# EasyEDA Pro project mini_autotune_v0.6_20261118-0322.epro

# Schematic Main

## Sheets
1 电源
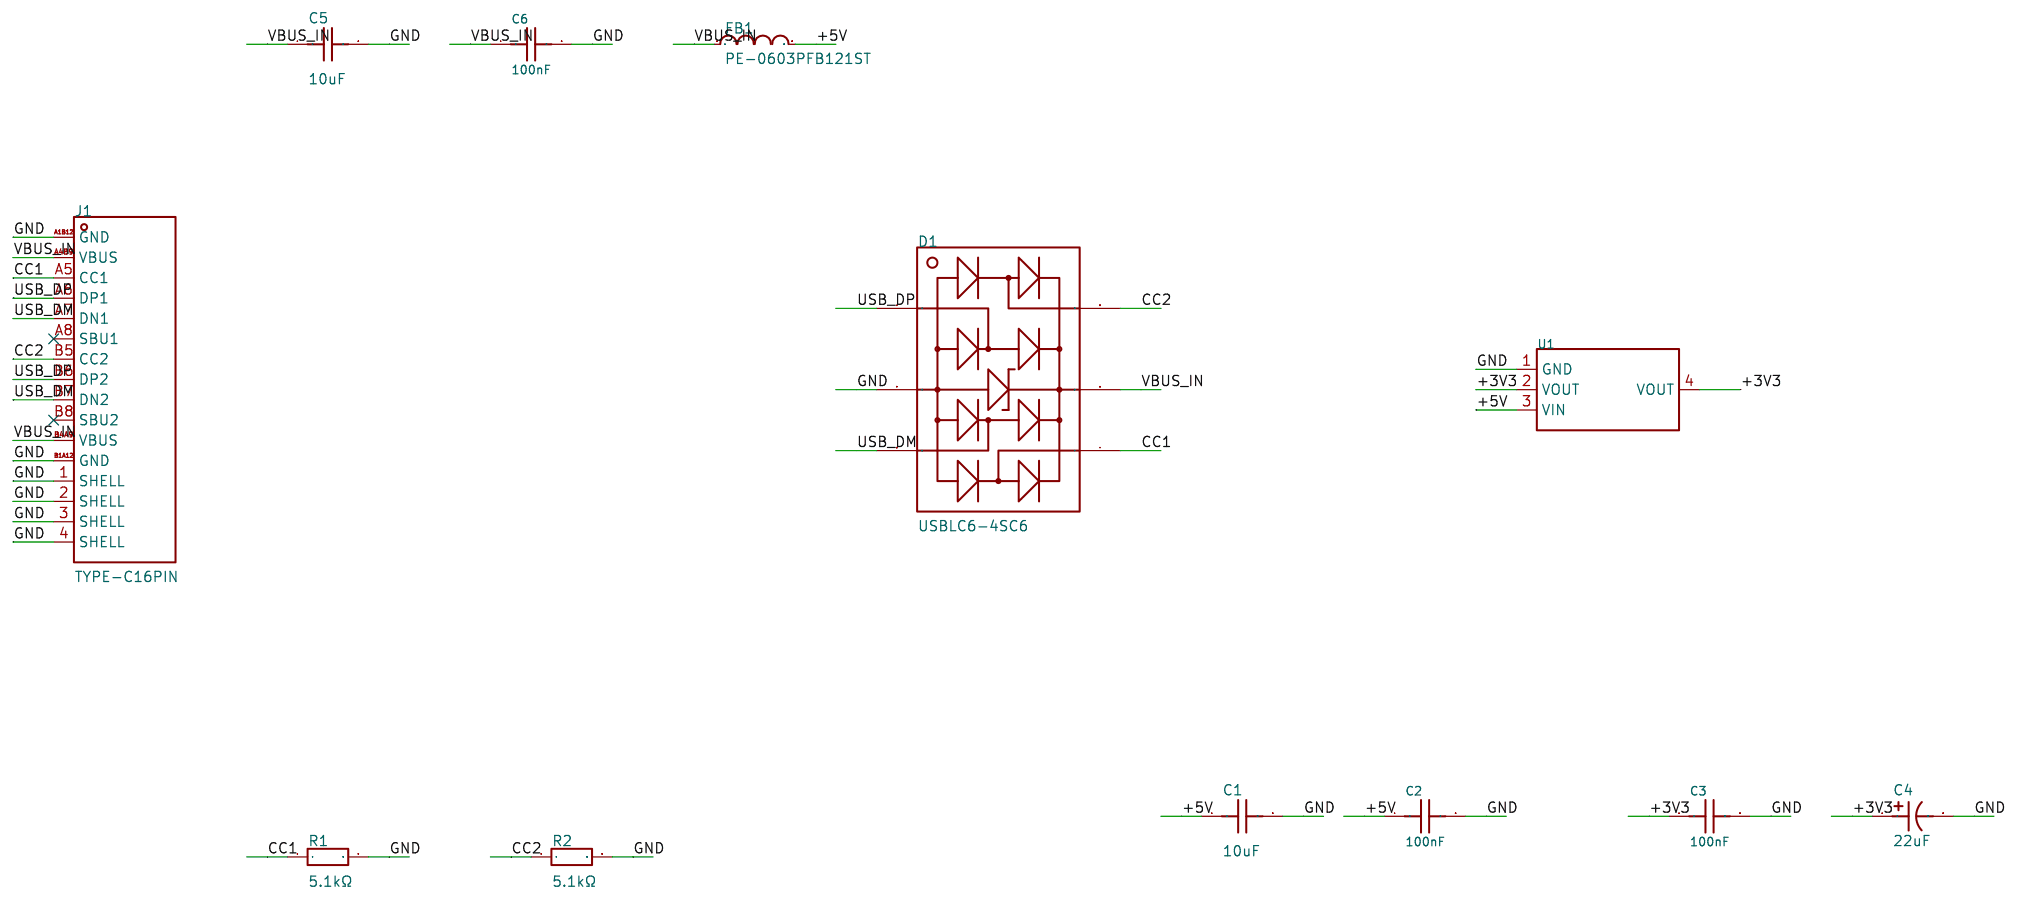
[diagram p0: 电源]
2 主控
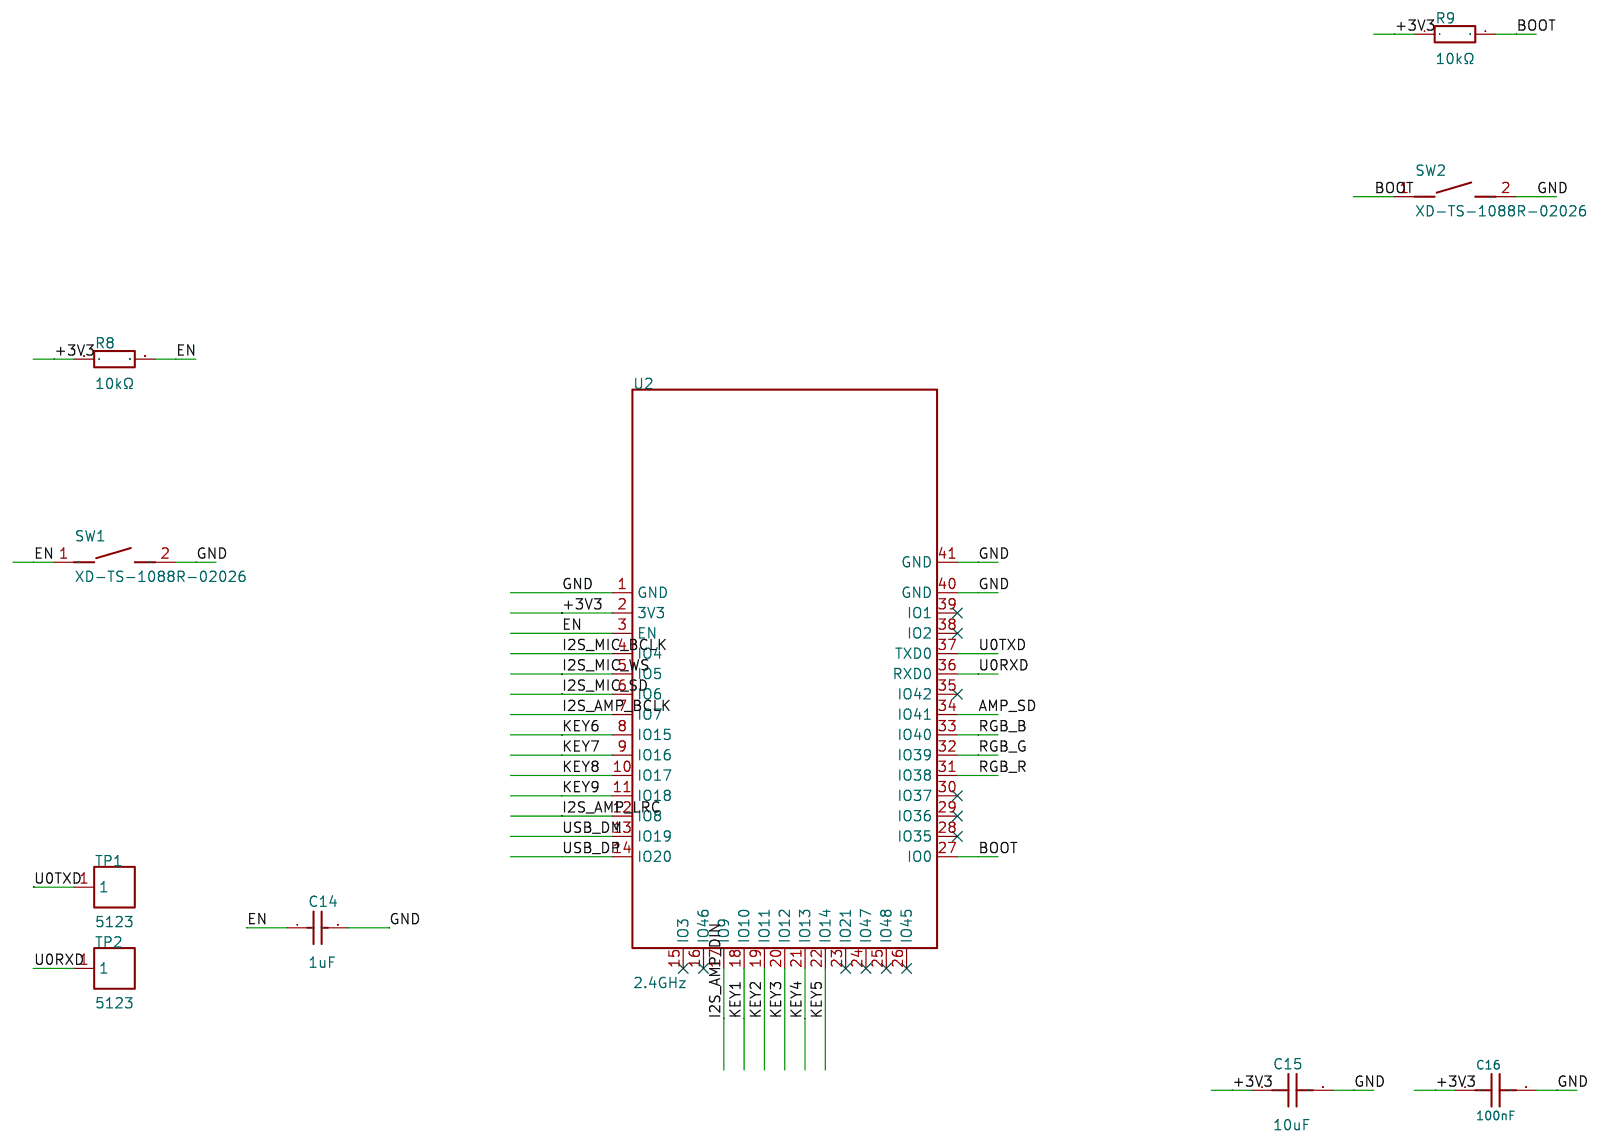
[diagram p1: 主控]
3 音频
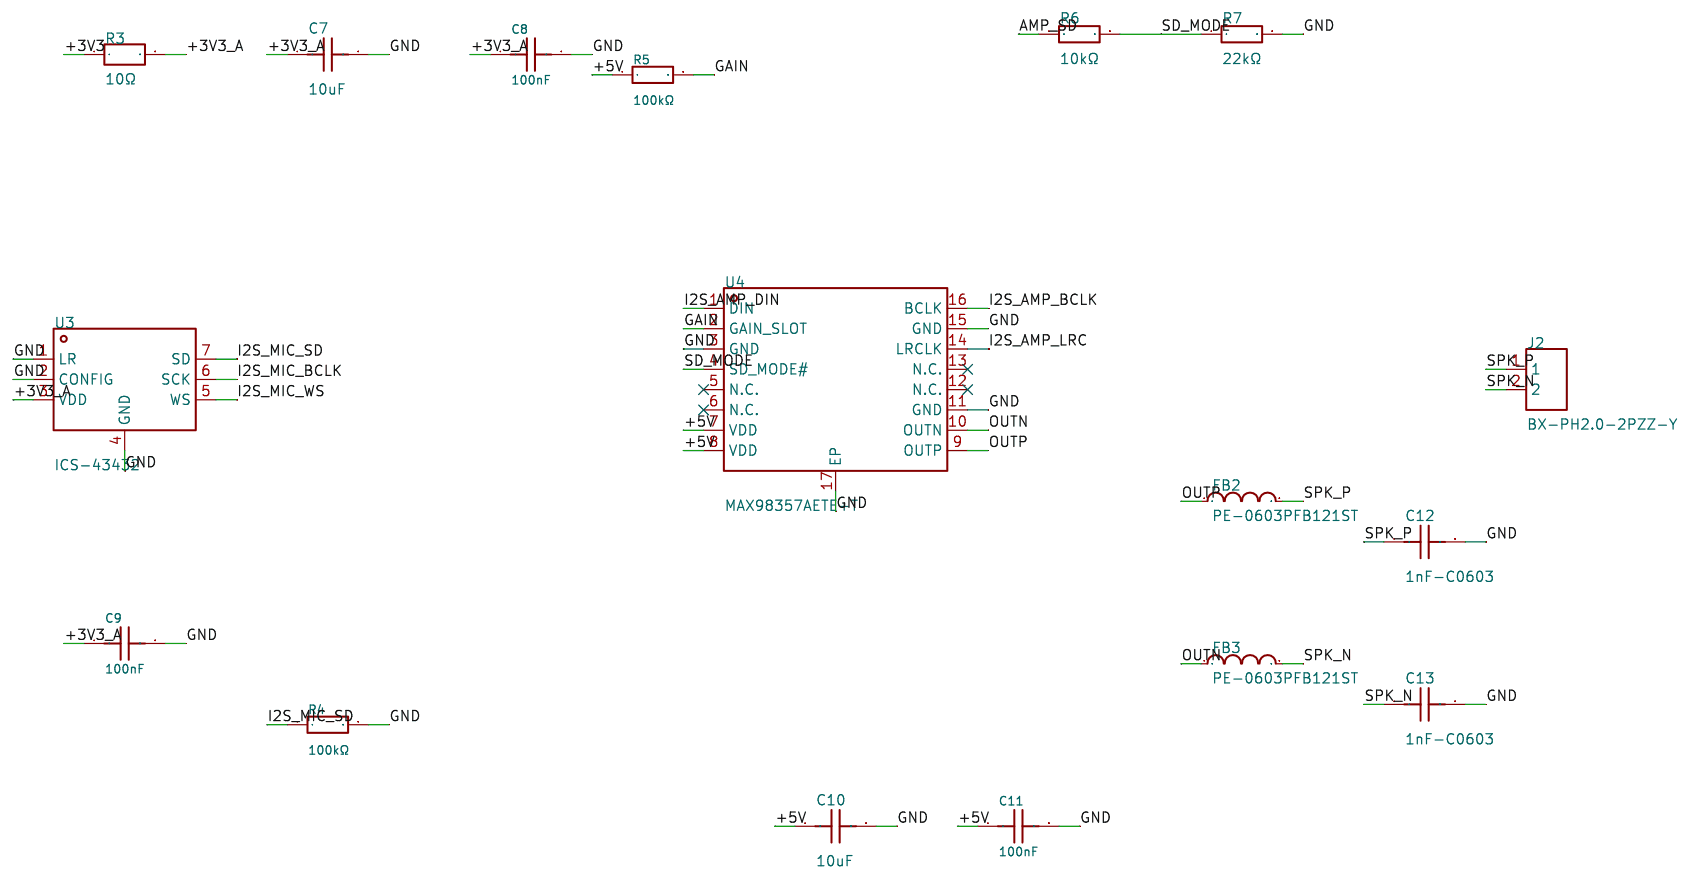
[diagram p2: 音频]
4 人机交互
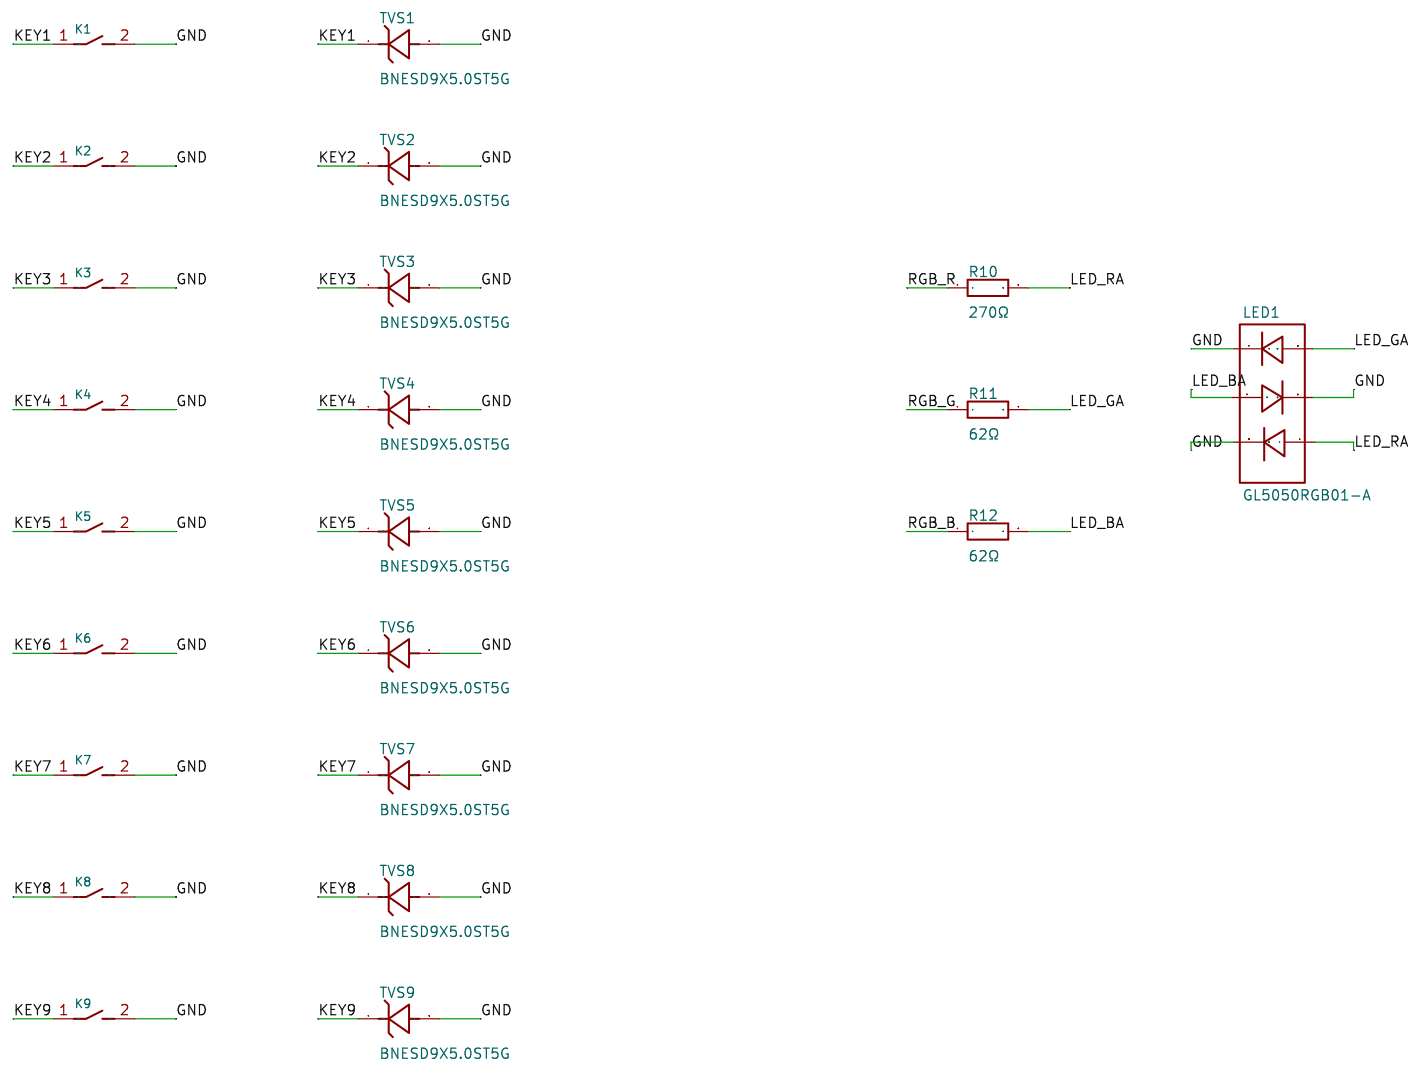
[diagram p3: 人机交互]

## Parts
sheet 主控
C14  1uF  [C0603]
C15  10uF  [C0603]
C16  100nF  [C0603]
R8  10kΩ  [R0603]
R9  10kΩ  [R0603]
SW1  XD-TS-1088R-02026  [SW-SMD_L3.9-W3.0_TS-1088-AR02026]
SW2  XD-TS-1088R-02026  [SW-SMD_L3.9-W3.0_TS-1088-AR02026]
TP1  5123  [TP-TH_5123]  (no BOM)
TP2  5123  [TP-TH_5123]  (no BOM)
U2  2.4GHz  [WIRELM-SMD_ESP32-S3-WROOM-1]
sheet 人机交互
K1  TS50610-411-02028  [KEY-SMD_L3.9-W3.0-LS5.0_1]
K2  TS50610-411-02028  [KEY-SMD_L3.9-W3.0-LS5.0_1]
K3  TS50610-411-02028  [KEY-SMD_L3.9-W3.0-LS5.0_1]
K4  TS50610-411-02028  [KEY-SMD_L3.9-W3.0-LS5.0_1]
K5  TS50610-411-02028  [KEY-SMD_L3.9-W3.0-LS5.0_1]
K6  TS50610-411-02028  [KEY-SMD_L3.9-W3.0-LS5.0_1]
K7  TS50610-411-02028  [KEY-SMD_L3.9-W3.0-LS5.0_1]
K8  TS50610-411-02028  [KEY-SMD_L3.9-W3.0-LS5.0_1]
K9  TS50610-411-02028  [KEY-SMD_L3.9-W3.0-LS5.0_1]
LED1  GL5050RGB01-A  [LED-SMD_6P-L5.0-W5.0_GL5050RGB01-A]
R10  270Ω  [R0603]
R11  62Ω  [R0603]
R12  62Ω  [R0603]
TVS1  BNESD9X5.0ST5G  [DFN1006-2L-RD]
TVS2  BNESD9X5.0ST5G  [DFN1006-2L-RD]
TVS3  BNESD9X5.0ST5G  [DFN1006-2L-RD]
TVS4  BNESD9X5.0ST5G  [DFN1006-2L-RD]
TVS5  BNESD9X5.0ST5G  [DFN1006-2L-RD]
TVS6  BNESD9X5.0ST5G  [DFN1006-2L-RD]
TVS7  BNESD9X5.0ST5G  [DFN1006-2L-RD]
TVS8  BNESD9X5.0ST5G  [DFN1006-2L-RD]
TVS9  BNESD9X5.0ST5G  [DFN1006-2L-RD]
sheet 电源
C1  10uF  [C0603]
C2  100nF  [C0603]
C3  100nF  [C0603]
C4  22uF  [CAP-SMD_L3.2-W1.6]
C5  10uF  [C0603]
C6  100nF  [C0603]
D1  USBLC6-4SC6  [SOT-23-6_L2.9-W1.6-P0.95-LS2.8-BR]
FB1  PE-0603PFB121ST  [L0603]
J1  TYPE-C16PIN  [USB-C-SMD_TYPE-C16PIN]
R1  5.1kΩ  [R0603]
R2  5.1kΩ  [R0603]
U1  AMS1117-3.3  [SOT-223-3_L6.5-W3.4-P2.30-LS7.0-BR]
sheet 音频
C7  10uF  [C0603]
C8  100nF  [C0603]
C9  100nF  [C0603]
C10  10uF  [C0603]
C11  100nF  [C0603]
C12  1nF-C0603  [C0603]
C13  1nF-C0603  [C0603]
FB2  PE-0603PFB121ST  [L0603]
FB3  PE-0603PFB121ST  [L0603]
J2  BX-PH2.0-2PZZ-Y  [CONN-TH_2P-P2.00_HC-PH-2A-TW]
R3  10Ω  [R0603]
R4  100kΩ  [R0603]
R5  100kΩ  [R0603]
R6  10kΩ  [R0603]
R7  22kΩ  [R0603]
U3  ICS-43432  [SENSOR-SMD_ICS-43432]
U4  MAX98357AETE+T  [TQFN-16_L3.0-W3.0-P0.50-BL-EP1.5]

## Library data of the parts
C14 = CL10B105KA8NNNC: 容值:1uF;精度:±10%;额定电压:25V;温度系数:X7R;; LCSC Part Name: 1uF ±10% 25V; Supplier Part: C29936; Manufacturer: SAMSUNG(三星); Supplier Footprint: 0603; JLCPCB Part Class: Extended Part; Datasheet: https://item.szlcsc.com/datasheet/CL10B105KA8NNNC/30690.html; Supplier: LCSC; Tolerance: ±10%; Voltage Rating: 25V; Temperature Coefficient: X7R
C1 C5 C7 C10 C15 = CL10A106MA8NRNC: 容值:10uF;精度:±20%;额定电压:25V;温度系数:X5R;; LCSC Part Name: 10uF ±20% 25V; Supplier Part: C96446; Manufacturer: SAMSUNG(三星); Supplier Footprint: 0603; JLCPCB Part Class: Basic Part; Datasheet: https://item.szlcsc.com/datasheet/CL10A106MA8NRNC/97651.html; Supplier: LCSC; Tolerance: ±20%; Voltage Rating: 25V; Temperature Coefficient: X5R; PCB Layer: Default
C2 C3 C6 C8 C9 C11 C16 = CC0603KRX7R9BB104: 容值:100nF;精度:±10%;额定电压:50V;温度系数:X7R;; LCSC Part Name: 100nF ±10% 50V; Supplier Part: C14663; Manufacturer: YAGEO(国巨); Supplier Footprint: 0603; JLCPCB Part Class: Basic Part; Datasheet: https://item.szlcsc.com/datasheet/CC0603KRX7R9BB104/15331.html; Supplier: LCSC; Tolerance: ±10%; Voltage Rating: 50V; Temperature Coefficient: X7R; PCB Layer: Default
R6 R8 R9 = 0603WAF1002T5E: 电阻类型:厚膜电阻;阻值:10kΩ;精度:±1%;功率:100mW;工作电压:75V;温度系数:±100ppm/℃;; LCSC Part Name: 厚膜电阻 10kΩ ±1% 100mW; Supplier Part: C25804; Manufacturer: UNI-ROYAL(厚声); Supplier Footprint: 0603; JLCPCB Part Class: Basic Part; Datasheet: https://item.szlcsc.com/datasheet/0603WAF1002T5E/26547.html; Supplier: LCSC; Type: 厚膜电阻; Tolerance: ±1%; Power(Watts): 100mW; Voltage-Supply(Max): 75V; Temperature Coefficient: ±100ppm/℃; Operating Temperature: -55℃~+155℃; PCB Layer: Default
SW1 SW2 = TS-1088-AR03016: 轻触开关 3.9x3.0mm SMD 2脚; LCSC Part Name: 轻触开关 3.9x3.0 立贴; Supplier Part: C56165515; Manufacturer: chxunda(讯普); Supplier Footprint: SMD,3.9x3mm; JLCPCB Part Class: Extended Part; Datasheet: https://www.lcsc.com/product-detail/C56165515.html; Supplier: LCSC; PCB Layer: Default
TP1 TP2 = 5123: 特性：彩色标记,便于观察和快速识别。是PC测试点终端的经济选择。卡扣式安装,为波峰焊提供可靠固定。线环设计,确保安全防滑测试。节省空间,有超薄和低轮廓设计。高轮廓设计,适用于难以触及的应用。适用于0.062(1.57)和0.093(2.36)PC板的高密度封装。可有效替代绕线柱和绕线架。能牢固夹住J型钩、EZ型钩、抓取器、鳄鱼夹、测试头或探针。高温尼龙底座,非常适合回流焊。非常适合可靠的生产测试和现场服务故障排除; LCSC Part Name: 通孔安装测试点，颜色标识; Supplier Part: C5272786; Manufacturer: Keystone; JLCPCB Part Class: Extended Part; Datasheet: https://item.szlcsc.com/datasheet/5123/6001347.html; Supplier: LCSC; Connector Type: 插针型(穿板); Plastic Color: 灰色; Board Space (Diameter φ/ Length x Width): 3.2mm
U2 = ESP32-S3-WROOM-1-N16R8: 核心芯片:ESP32-S3R8;频率:2.4GHz;天线形式:板载PCB天线;发射功率:20.5dBm;接收灵敏度:-103.5dBm;; LCSC Part Name: 不带固件 通用型Wi-Fi+低功耗蓝牙MCU模组; Supplier Part: C2913202; Manufacturer: ESPRESSIF(乐鑫); Supplier Footprint: SMD,25.5x18mm; JLCPCB Part Class: Extended Part; Datasheet: https://item.szlcsc.com/datasheet/ESP32-S3-WROOM-1-N16R8/3198300.html; Supplier: LCSC; Utilized IC / Part: ESP32-S3R8; Interface Type: I2C；GPIO；UART；SPI；USB；I2S; Antenna Type: 板载PCB天线; Output Power: 20.5dBm; Voltage - Supply: 3V~3.6V; Receive  Current: 95mA; Send  Current: 355mA; Sensitivity: -103.5dBm; Operating Temperature: -40℃~+65℃; PCB Layer: Default
K1-K9 = TS50610-411-02028: 电路结构:单刀单掷;按钮形状:圆形按钮;安装方式:立贴;开关长度:4mm;开关宽度:3mm;开关高度:2mm;带支架:不带支架;触点电流:50mA;额定电压:12V;; LCSC Part Name: 3.9*2.93*2mm 立贴 轻触开关; Supplier Part: C42400866; Manufacturer: HMTCONN(华明通); Supplier Footprint: SMD,3.9x3mm; JLCPCB Part Class: Extended Part; Datasheet: https://item.szlcsc.com/datasheet/TS50610-411-02028/44355790.html; Supplier: LCSC; Circuit: 单刀单掷; Actuator Style: 圆形按钮; Mounting Type: 立贴; Length: 4mm; Width: 3mm; Switch Height: 2mm; with Bracket: 不带支架; Contact Current: 50mA; Voltage Rating: 12V; Actuator/Cap Color: 黑色; Termination Style: SMD接片
LED1 = GL5050RGB01-A: 5050RGB 0.2w 共阴 透明 缺口负 负极朝孔; LCSC Part Name: 5050RGB 0.2w 共阴 透明 缺口负 负极朝孔; Supplier Part: C51933351; Manufacturer: Guiguang light(桂光光电); Supplier Footprint: SMD5050-6P; JLCPCB Part Class: Extended Part; Datasheet: https://item.szlcsc.com/datasheet/GL5050RGB01-A/54646047.html; Supplier: LCSC; Diode Configuration: 共阴极; Dominant Wavelength - R: 610nm~630nm; Dominant Wavelength - G: 515nm~530nm; Dominant Wavelength - B: 460nm~475nm; Viewing Angle: 120°; Lens Color: 白色透镜; Peak Wavelength - R: 625nm; Peak Wavelength - G: 525nm; Peak Wavelength - B: 470nm; Operating Temperature: -40℃~+85℃; Length: 5.4mm; Width: 5mm; Height: 1.6mm; Luminous Intensity - R: 300mcd~500mcd; Luminous Intensity - G: 1000mcd~1200mcd; Luminous Intensity - B: 350mcd~450mcd; Forward Voltage(Vf) - R: 2V~2.3V; Forward Voltage(Vf) - G: 2.9V~3.2V; Forward Voltage(Vf) - B: 2.9V~3.2V; Forward Current - R: 20mA; Forward Current - G: 20mA; Forward Current - B: 20mA; Power(Watts) - R: 70mW; Power(Watts) - G: 90mW; Power(Watts) - B: 90mW; PCB Layer: Default
R10 = 0603WAF2700T5E: 电阻类型:厚膜电阻;阻值:270Ω;精度:±1%;功率:100mW;工作电压:75V;温度系数:±100ppm/℃;; LCSC Part Name: 270Ω ±1% 100mW 厚膜电阻; Supplier Part: C22966; Manufacturer: UNI-ROYAL(厚声); Supplier Footprint: 0603; JLCPCB Part Class: Basic Part; Datasheet: https://item.szlcsc.com/datasheet/0603WAF2700T5E/23693.html; Supplier: LCSC; Type: 厚膜电阻; Tolerance: ±1%; Power(Watts): 100mW; Voltage-Supply(Max): 75V; Temperature Coefficient: ±100ppm/℃; Operating Temperature: -55℃~+155℃; PCB Layer: Default
R11 R12 = RC0603FR-0762RL: 电阻类型:厚膜电阻;阻值:62Ω;精度:±1%;功率:100mW;工作电压:75V;温度系数:±100ppm/℃;; LCSC Part Name: 厚膜电阻 62Ω ±1% 100mW; Supplier Part: C245989; Manufacturer: YAGEO(国巨); Supplier Footprint: 0603; JLCPCB Part Class: Extended Part; Datasheet: https://item.szlcsc.com/datasheet/RC0603FR-0762RL/243490.html; Supplier: LCSC; Type: 厚膜电阻; Tolerance: ±1%; Power(Watts): 100mW; Voltage-Supply(Max): 75V; Temperature Coefficient: ±100ppm/℃; Operating Temperature: -55℃~+155℃; PCB Layer: Default
TVS1-TVS9 = BNESD9X5.0ST5G: 极性:单向;反向截止电压(Vrwm):5V;钳位电压:12V;峰值脉冲电流(Ipp):7A@8/20us;峰值脉冲功率(Ppp):70W@8/20us;击穿电压(VBR):7.2V;; LCSC Part Name: 单向ESD 5V截止 峰值浪涌电流：7A@8/20us; Supplier Part: C19077972; Manufacturer: BORN(伯恩半导体); Supplier Footprint: DFN1006-2; JLCPCB Part Class: Extended Part; Datasheet: https://item.szlcsc.com/datasheet/BNESD9X5.0ST5G/20278809.html; Supplier: LCSC; Polarity: 单向; Reverse Stand-Off Voltage (Vrwm): 5V; Clamping Voltage: 12V; Peak Pulse Current (Ipp): 7A@8/20us; Peak Pulse Power Dissipation (Ppp): 70W@8/20us; Voltage - Breakdown: 7.2V; Reverse Leakage Current (Ir): 500nA; Number of Channels: 单路; level of protection: IEC 61000-4-4；IEC 61000-4-5；IEC 61000-4-2; Type: ESD; Junction Capacitance: 50pF; PCB Layer: Default
C4 = CA45-A-16V-22uF-K: 容值:22uF;精度:±10%;额定电压:16V;等效串联电阻(ESR):6Ω@100kHz;; LCSC Part Name: 22uF ±10% 16V; Supplier Part: C782264; Manufacturer: CEC(振华新云); Supplier Footprint: CASE-A-3216-16(mm); JLCPCB Part Class: Extended Part; Datasheet: https://item.szlcsc.com/datasheet/CA45-A-16V-22uF-K/836060.html; Supplier: LCSC; Tolerance: ±10%; Voltage Rating: 16V; Equivalent Series Resistance(ESR): 6Ω@100kHz; Operating Temperature: -55℃~+125℃; PCB Layer: Default
D1 = USBLC6-4SC6: 反向截止电压(Vrwm):5.25V;最大钳位电压:17V;峰值脉冲电流(Ipp)@10/1000us:5A;击穿电压:6V;; Supplier Part: C252436; Supplier Footprint: SOT-23-6; JLCPCB Part Class: Extended Part; Datasheet: https://atta.szlcsc.com/upload/public/pdf/source/20180716/C252436_B87140B9F71D34601A0A2B5675133B53.pdf; Supplier: LCSC; Reverse Stand-Off Voltage (Vrwm): 5.25V; Maximum Clamping Voltage: 17V; Peak Pulse Current (Ipp)@10/1000us: 5A; Breakdown Voltage: 6V; Type: ESD; PCB Layer: Default
FB1-FB3 = PE-0603PFB121ST: 阻抗@频率:120Ω@100MHz;误差:±25%;直流电阻(DCR):50mΩ;; LCSC Part Name: 120 Ω @ 100MHz 2A; Supplier Part: C2661472; Manufacturer: PULSE(普思); Supplier Footprint: 0603; JLCPCB Part Class: Extended Part; Datasheet: https://item.szlcsc.com/datasheet/PE-0603PFB121ST/2753383.html; Supplier: LCSC; Impedance @ Frequency: 120Ω@100MHz; Tolerance: ±25%; DC Resistance(DCR): 50mΩ; Current Rating: 2A; Number of Circuits: 1; Operating Temperature: -40℃~+125℃; PCB Layer: Default
J1 = TYPE-C16PIN: 连接器类型:Type-C;协议标准:-;公母:母;安装方式:卧贴;触点数量:16P;端口数量:1;额定电流 - 电源:3A;工作温度:-25℃~+85℃;; LCSC Part Name: Type-C 母 卧贴; Supplier Part: C393939; Manufacturer: SHOU HAN(首韩); Supplier Footprint: SMD; JLCPCB Part Class: Extended Part; Datasheet: https://item.szlcsc.com/datasheet/TYPE-C16PIN/372551.html; Supplier: LCSC; Connector Type: Type-C; Gender: 母; Mounting Type: 卧贴; Number of Contacts: 16P; Number of Ports: 1; Current Rating-Power: 3A; Voltage Rating: 5V; Connect-Disconnect Life: 1万次; Length: 7.35mm; Detection color: 黑色; Operating Temperature: -25℃~+85℃
R1 R2 = RMC06035.1K1%N: 电阻类型:厚膜电阻;阻值:5.1kΩ;精度:±1%;功率:100mW;工作电压:50V;温度系数:±100ppm/℃;; LCSC Part Name: 厚膜电阻 5.1kΩ ±1% 100mW; Supplier Part: C269716; Manufacturer: Tyohm(幸亚电阻); Supplier Footprint: 0603; JLCPCB Part Class: Extended Part; Datasheet: https://item.szlcsc.com/datasheet/RMC06035.1K1%2525N/259156.html; Supplier: LCSC; Type: 厚膜电阻; Tolerance: ±1%; Power(Watts): 100mW; Voltage-Supply(Max): 50V; Temperature Coefficient: ±100ppm/℃; Operating Temperature: -55℃~+155℃; PCB Layer: Default
U1 = AMS1117-3.3_C6186: 输出极性:正极;工作电压:15V;输出电压:3.3V;输出电流:1A;电源纹波抑制比(PSRR):72dB@(120Hz);输出类型:固定;; LCSC Part Name: 3.3V 1A 15V; Supplier Part: C6186; Manufacturer: Advanced Monolithic Systems; Supplier Footprint: SOT-223; JLCPCB Part Class: Basic Part; Datasheet: https://item.szlcsc.com/datasheet/AMS1117-3.3/6652.html; Supplier: LCSC; Output Configuration: 正极; Voltage - Supply: 15V; Output Voltage: 3.3V; Output Current: 1A; Power Supply Rejection Ratio (PSRR): 72dB@(120Hz); Voltage Dropout: 1.1V@(800mA); standby current: 5mA; Noise: 0.003%Vout; Features: 短路保护；热关断；过流保护; Operating Temperature: -40℃~+125℃; Output Type: 固定; Number of Outputs: 1
C12 C13 = 1nF-C0603: Supplier Part: C2940049; Supplier Footprint: 0603; JLCPCB Part Class: Extended Part; Supplier: LCSC; PCB Layer: Default
J2 = BX-PH2.0-2PZZ-Y: 插针结构:1x2P;间距:2mm;安装方式:直插;参考系列:PH;总PIN数:2P;排数:1;每排PIN数:2;行距:-;额定电流:2A;触头材质:铜合金;触头镀层:锡;工作温度:-25℃~+85℃;; LCSC Part Name: 1x2P 间距:2mm 直插 系列:PH; Supplier Part: C22388468; Manufacturer: Bossie(博锡); Supplier Footprint: 插件,P=2mm; JLCPCB Part Class: Extended Part; Datasheet: https://item.szlcsc.com/datasheet/BX-PH2.0-2PZZ-Y/23956733.html; Supplier: LCSC; Pins Structure: 1x2P; Pitch: 2mm; Mounting Type: 直插; Reference Series: PH; Number of Pins: 2P; Number of Rows: 1; Number of PINs Per Row: 2; Current Rating: 2A; Contact Material: 铜合金; Contact Plating: 锡; Operating Temperature: -25℃~+85℃; Voltage Rating: 200V; Plastic Material: PA66; Color: 黄色; Z-Height of the Board: 6.05mm; X-Length of Bottom Edge on Board (Spacing Line): 6mm; Y-Width of Bottom Edge on Board: 4.7mm; PCB Layer: Default
R3 = 0603 ±5% 10Ω: 电阻类型:厚膜电阻;阻值:10Ω;精度:±5%;功率:100mW;最大工作电压:75V;温度系数:±100ppm/℃;; LCSC Part Name: 厚膜电阻 10Ω ±5% 100mW; Supplier Part: C2889398; Manufacturer: VO(翔胜); Supplier Footprint: 0603; JLCPCB Part Class: Extended Part; Datasheet: https://atta.szlcsc.com/upload/public/pdf/source/20210902/777BF6DFB3B29B13210374B07BC23D84.pdf; Supplier: LCSC; Type: 厚膜电阻; Tolerance: ±5%; Power(Watts): 100mW; Overload Voltage (Max): 75V; Temperature Coefficient: ±100ppm/℃; Operating Temperature Range: -55℃~+155℃; PCB Layer: Default
R4 R5 = 0603WAF1003T5E: 电阻类型:厚膜电阻;阻值:100kΩ;精度:±1%;功率:100mW;工作电压:75V;温度系数:±100ppm/℃;; LCSC Part Name: 厚膜电阻 100kΩ ±1% 100mW; Supplier Part: C25803; Manufacturer: UNI-ROYAL(厚声); Supplier Footprint: 0603; JLCPCB Part Class: Basic Part; Datasheet: https://item.szlcsc.com/datasheet/0603WAF1003T5E/26546.html; Supplier: LCSC; Type: 厚膜电阻; Tolerance: ±1%; Power(Watts): 100mW; Voltage-Supply(Max): 75V; Temperature Coefficient: ±100ppm/℃; Operating Temperature: -55℃~+155℃; PCB Layer: Default
R7 = 0603WAF2202T5E: 电阻类型:厚膜电阻;阻值:22kΩ;精度:±1%;功率:100mW;工作电压:75V;温度系数:±100ppm/℃;; LCSC Part Name: 22kΩ ±1% 100mW 厚膜电阻; Supplier Part: C31850; Manufacturer: UNI-ROYAL(厚声); Supplier Footprint: 0603; JLCPCB Part Class: Basic Part; Datasheet: https://item.szlcsc.com/datasheet/0603WAF2202T5E/32812.html; Supplier: LCSC; Type: 厚膜电阻; Tolerance: ±1%; Power(Watts): 100mW; Voltage-Supply(Max): 75V; Temperature Coefficient: ±100ppm/℃; Operating Temperature: -55℃~+155℃; PCB Layer: Default
U3 = ICS-43432: 指向性:全指向;信噪比:65dB;灵敏度:-26dB;阻抗:-;; LCSC Part Name: 音频传感器; Supplier Part: C574021; Manufacturer: TDK InvenSense(应美盛); Supplier Footprint: SMD-7P,3x4mm; JLCPCB Part Class: Extended Part; Datasheet: https://item.szlcsc.com/datasheet/ICS-43432/601949.html; Supplier: LCSC; Direction: 全指向; Voltage - Supply: 1.62V~3.63V; Current Consumption: 1.5mA; S/N Ratio: 65dB; Sensitivity: -26dB; Output Type: I2S; Length: 4mm; Width: 3mm; Height: 1mm; Features: 全向拾音; Frequency Range: 50Hz~20kHz; PCB Layer: Default
U4 = MAX98357AETE+T: 功放类型:D类功放;扬声器通道数:-;输出功率:3.2Wx1@4Ω;静态电流(Iq):2.4mA;; LCSC Part Name: 微型、低成本、PCM 类 D 级放大器具有 AB 级性能; Supplier Part: C910544; Manufacturer: ADI(亚德诺)/MAXIM(美信); Supplier Footprint: TQFN-16-EP(3x3); JLCPCB Part Class: Extended Part; Datasheet: https://item.szlcsc.com/datasheet/MAX98357AETE%252BT/978950.html; Supplier: LCSC; Class: D类功放; Output Power: 3.2Wx1@4Ω; Total Harmonic Distortion + Noise (THD+N): 0.06%; Quiescent Current: 2.4mA; Power Supply Rejection Ratio (PSRR): 77dB; Efficiency: 92%; Features: 无滤波器架构；自动静音/免噪音开关；使能/关断功能; Voltage - Supply: 2.5V~5.5V; Operating Temperature: -40℃~+85℃; PCB Layer: Default

## Nets
+3V3: C3.1 C4.1 C15.1 C16.1 R3.1 R8.1 R9.1 U1.2(VOUT) U1.4(VOUT) U2.2(3V3)
+3V3_A: C7.1 C8.1 C9.1 R3.2 U3.3(VDD)
+5V: C1.1 C2.1 C10.1 C11.1 FB1.2 R5.1 U1.3(VIN) U4.7(VDD) U4.8(VDD)
GND: C1.2 C2.2 C3.2 C4.2 C5.2 C6.2 C7.2 C8.2 C9.2 C10.2 C11.2 C12.2 C13.2 C14.2 C15.2 C16.2 D1.2 J1.1(SHELL) J1.2(SHELL) J1.3(SHELL) J1.4(SHELL) J1.A1B12(GND) J1.B1A12(GND) K1.2 K2.2 K3.2 K4.2 K5.2 K6.2 K7.2 K8.2 K9.2 LED1.1 LED1.3 LED1.5 R1.2 R2.2 R4.2 R7.2 SW1.2 SW2.2 TVS1.2(A) TVS2.2(A) TVS3.2(A) TVS4.2(A) TVS5.2(A) TVS6.2(A) TVS7.2(A) TVS8.2(A) TVS9.2(A) U1.1(GND) U2.1(GND) U2.40(GND) U2.41(GND) U3.1(LR) U3.2(CONFIG) U3.4(GND) U4.3(GND) U4.11(GND) U4.15(GND) U4.17(EP)
VBUS_IN: C5.1 C6.1 D1.5 FB1.1 J1.A4B9(VBUS) J1.B4A9(VBUS)
AMP_SD: R6.1 U2.34(IO41)
BOOT: R9.2 SW2.1 U2.27(IO0)
CC1: D1.4 J1.A5(CC1) R1.1
CC2: D1.6 J1.B5(CC2) R2.1
EN: C14.1 R8.2 SW1.1 U2.3(EN)
GAIN: R5.2 U4.2(GAIN_SLOT)
I2S_AMP_BCLK: U2.7(IO7) U4.16(BCLK)
I2S_AMP_DIN: U2.17(IO9) U4.1(DIN)
I2S_AMP_LRC: U2.12(IO8) U4.14(LRCLK)
I2S_MIC_BCLK: U2.4(IO4) U3.6(SCK)
I2S_MIC_SD: R4.1 U2.6(IO6) U3.7(SD)
I2S_MIC_WS: U2.5(IO5) U3.5(WS)
KEY1: K1.1 TVS1.1(C) U2.18(IO10)
KEY2: K2.1 TVS2.1(C) U2.19(IO11)
KEY3: K3.1 TVS3.1(C) U2.20(IO12)
KEY4: K4.1 TVS4.1(C) U2.21(IO13)
KEY5: K5.1 TVS5.1(C) U2.22(IO14)
KEY6: K6.1 TVS6.1(C) U2.8(IO15)
KEY7: K7.1 TVS7.1(C) U2.9(IO16)
KEY8: K8.1 TVS8.1(C) U2.10(IO17)
KEY9: K9.1 TVS9.1(C) U2.11(IO18)
LED_BA: LED1.2 R12.2
LED_GA: LED1.6 R11.2
LED_RA: LED1.4 R10.2
OUTN: FB3.1 U4.10(OUTN)
OUTP: FB2.1 U4.9(OUTP)
RGB_B: R12.1 U2.33(IO40)
RGB_G: R11.1 U2.32(IO39)
RGB_R: R10.1 U2.31(IO38)
SD_MODE: R6.2 R7.1 U4.4(SD_MODE#)
SPK_N: C13.1 FB3.2 J2.2
SPK_P: C12.1 FB2.2 J2.1
U0RXD: TP2.1 U2.36(RXD0)
U0TXD: TP1.1 U2.37(TXD0)
USB_DM: D1.3 J1.A7(DN1) J1.B7(DN2) U2.13(IO19)
USB_DP: D1.1 J1.A6(DP1) J1.B6(DP2) U2.14(IO20)

Not connected (* = marked no-connect by the designer): J1 A8(SBU1)* B8(SBU2)*; U2 15(IO3)* 16(IO46)* 23(IO21)* 24(IO47)* 25(IO48)* 26(IO45)* 28(IO35)* 29(IO36)* 30(IO37)* 35(IO42)* 38(IO2)* 39(IO1)*; U4 5(N.C.)* 6(N.C.)* 12(N.C.)* 13(N.C.)*
